# Altium schematic sheet PAGE01_CONTENT.SchDoc
size 246 x 182 mm
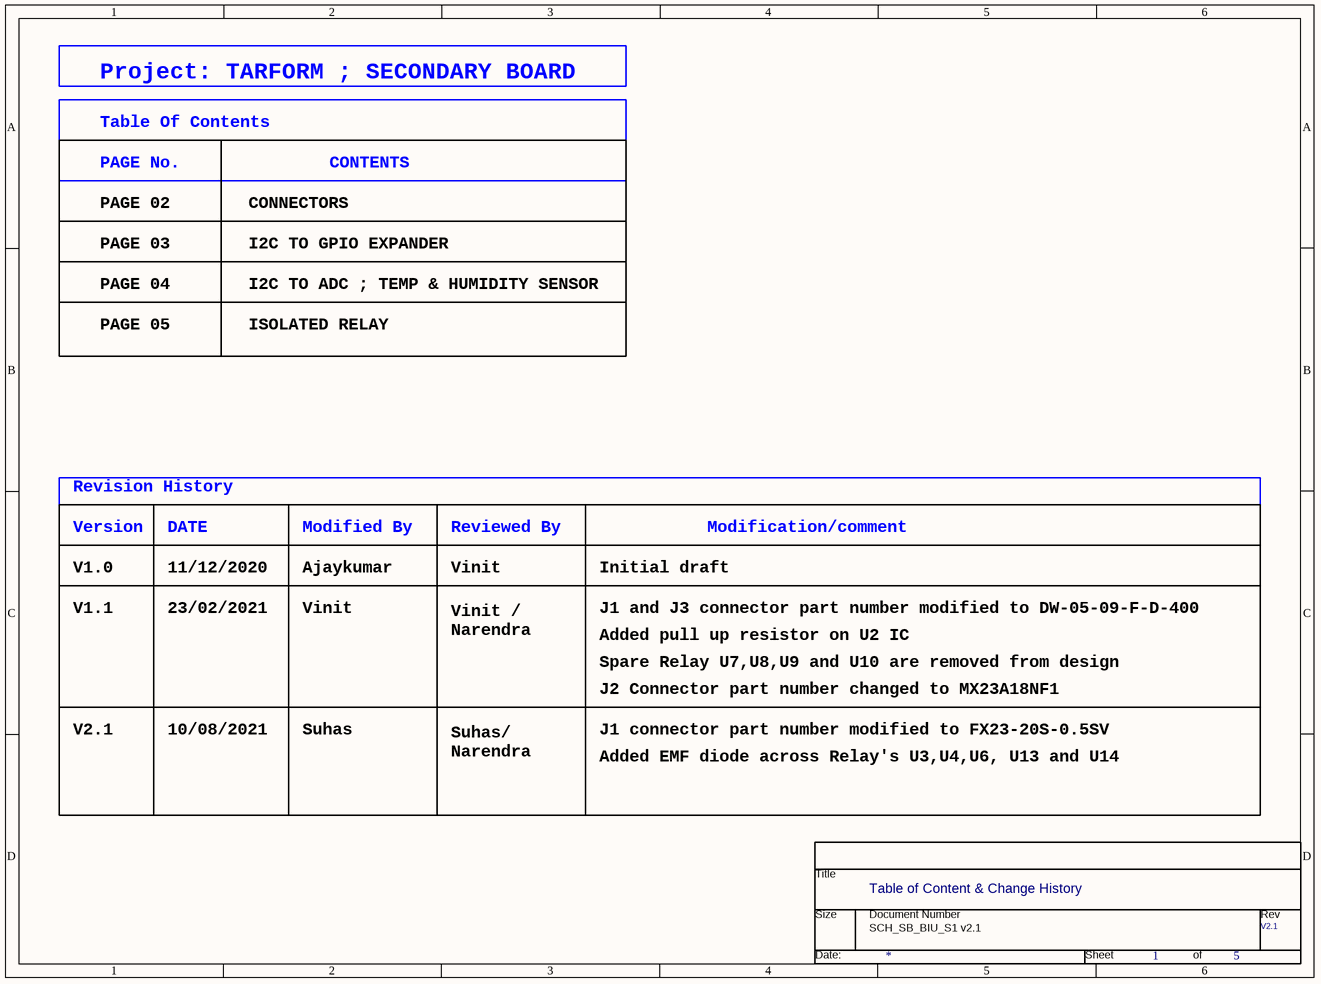
[diagram p0: PAGE01_CONTENT.SchDoc]

## Parts
*  Page Count: 5  Page Number: 1  Title: Table of Content & Change History  RevCode: V2.1  (hidden comment: TitleBlock0)  (graphical)

## Notes on the sheet
- Project: TARFORM ; SECONDARY BOARD
- Table Of Contents
- PAGE No.
- CONTENTS
- PAGE 03
- PAGE 02
- I2C TO GPIO EXPANDER
- CONNECTORS
- PAGE 05
- PAGE 04
- I2C TO ADC ; TEMP & HUMIDITY SENSOR
- ISOLATED RELAY
- Version
- Revision History
- DATE
- Modified By
- Reviewed By
- Modification/comment
- V1.0
- 11/12/2020
- Ajaykumar
- Vinit
- Vinit /
  Narendra
- Initial draft
- V1.1
- 23/02/2021
- J1 and J3 connector part number modified to DW-05-09-F-D-400
- Added pull up resistor on U2 IC
- Spare Relay U7,U8,U9 and U10 are removed from design
- V2.1
- 10/08/2021
- Suhas
- Suhas/
  Narendra
- J2 Connector part number changed to MX23A18NF1
- J1 connector part number modified to FX23-20S-0.5SV
- Added EMF diode across Relay's U3,U4,U6, U13 and U14
- SCH_SB_BIU_S1 v2.1
- (in symbol TitleBlock0) Title; Size; Document Number; Rev; Date:; Sheet; of

## Library data of the parts
* = TitleBlock0: Page Size: A; Page Create Date: March  8, 1995; Page Modify Date: *